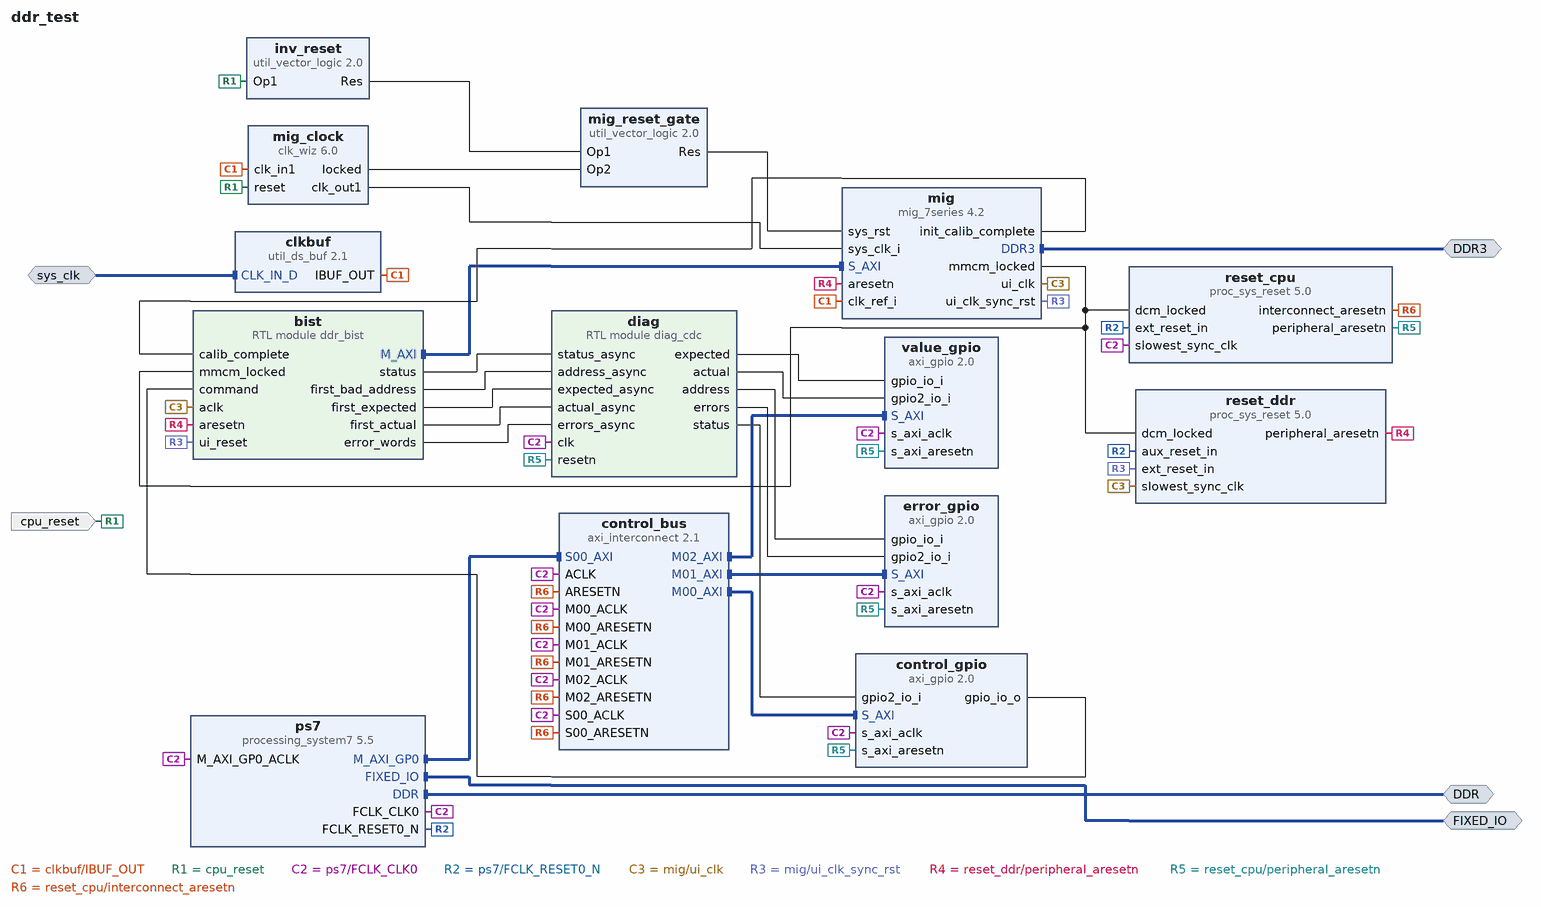
[diagram p0: block diagram of the top level]
# Vivado block design ddr_test, xc7z045ffg900-2, Vivado 2020.2
create_bd_design ddr_test

create_bd_intf_port -mode Master -vlnv xilinx.com:interface:ddrx_rtl:1.0 DDR
create_bd_intf_port -mode Master -vlnv xilinx.com:display_processing_system7:fixedio_rtl:1.0 FIXED_IO
create_bd_intf_port -mode Slave -vlnv xilinx.com:interface:diff_clock_rtl:1.0 sys_clk
set_property -dict {CONFIG.FREQ_HZ 200000000} [get_bd_intf_ports sys_clk]
create_bd_intf_port -mode Master -vlnv xilinx.com:interface:ddrx_rtl:1.0 DDR3
create_bd_port -dir I -type rst cpu_reset
set_property -dict {CONFIG.POLARITY ACTIVE_HIGH} [get_bd_ports cpu_reset]

create_bd_cell -type ip -vlnv xilinx.com:ip:processing_system7:5.5 ps7
set_property -dict [list \
  CONFIG.PCW_APU_PERIPHERAL_FREQMHZ 667.000000 \
  CONFIG.PCW_ENET0_PERIPHERAL_ENABLE 0 \
  CONFIG.PCW_FPGA0_PERIPHERAL_FREQMHZ 100 \
  CONFIG.PCW_GPIO_MIO_GPIO_ENABLE 1 \
  CONFIG.PCW_GPIO_MIO_GPIO_IO MIO \
  CONFIG.PCW_I2C_RESET_ENABLE 0 \
  CONFIG.PCW_PRESET_BANK0_VOLTAGE {LVCMOS 1.8V} \
  CONFIG.PCW_PRESET_BANK1_VOLTAGE {LVCMOS 1.8V} \
  CONFIG.PCW_QSPI_PERIPHERAL_ENABLE 0 \
  CONFIG.PCW_SD0_PERIPHERAL_ENABLE 0 \
  CONFIG.PCW_UART1_PERIPHERAL_ENABLE 1 \
  CONFIG.PCW_UART1_UART1_IO {MIO 48 .. 49} \
  CONFIG.PCW_UART_PERIPHERAL_FREQMHZ 100 \
  CONFIG.PCW_UIPARAM_DDR_FREQ_MHZ 533.333313 \
  CONFIG.PCW_UIPARAM_DDR_PARTNO Custom \
  CONFIG.PCW_USB0_PERIPHERAL_ENABLE 0 \
  CONFIG.PCW_USB_RESET_ENABLE 1 \
] [get_bd_cells ps7]
# 242 more settings of ps7 are not shown: defaults, MIO pin electricals, DDR timing, and values the tool derives
create_bd_cell -type ip -vlnv xilinx.com:ip:util_ds_buf:2.1 clkbuf
set_property -dict {CONFIG.C_BUF_TYPE IBUFDS} [get_bd_cells clkbuf]
create_bd_cell -type ip -vlnv xilinx.com:ip:clk_wiz:6.0 mig_clock
set_property -dict [list \
  CONFIG.CLKOUT1_REQUESTED_OUT_FREQ 166.666667 \
  CONFIG.PRIM_IN_FREQ 200 \
  CONFIG.RESET_TYPE ACTIVE_HIGH \
  CONFIG.USE_LOCKED true \
  CONFIG.USE_RESET true \
] [get_bd_cells mig_clock]
create_bd_cell -type ip -vlnv xilinx.com:ip:mig_7series:4.2 mig
set_property -dict [list \
  CONFIG.BOARD_MIG_PARAM Custom \
  CONFIG.RESET_BOARD_INTERFACE Custom \
  CONFIG.XML_INPUT_FILE ../../../../../../../constraints/ddr2g_mig.prj \
] [get_bd_cells mig]
create_bd_cell -type ip -vlnv xilinx.com:ip:util_vector_logic:2.0 inv_reset
set_property -dict {CONFIG.C_OPERATION not CONFIG.C_SIZE 1} [get_bd_cells inv_reset]
create_bd_cell -type ip -vlnv xilinx.com:ip:util_vector_logic:2.0 mig_reset_gate
set_property -dict {CONFIG.C_OPERATION and CONFIG.C_SIZE 1} [get_bd_cells mig_reset_gate]
create_bd_cell -type ip -vlnv xilinx.com:ip:proc_sys_reset:5.0 reset_cpu
set_property -dict {CONFIG.C_AUX_RESET_HIGH 0} [get_bd_cells reset_cpu]
create_bd_cell -type ip -vlnv xilinx.com:ip:proc_sys_reset:5.0 reset_ddr
set_property -dict {CONFIG.C_AUX_RESET_HIGH 0} [get_bd_cells reset_ddr]
create_bd_cell -type module -reference diag_cdc diag
create_bd_cell -type ip -vlnv xilinx.com:ip:axi_interconnect:2.1 control_bus
set_property -dict {CONFIG.NUM_MI 3} [get_bd_cells control_bus]
create_bd_cell -type ip -vlnv xilinx.com:ip:axi_gpio:2.0 control_gpio
set_property -dict [list \
  CONFIG.C_ALL_INPUTS 0 \
  CONFIG.C_ALL_INPUTS_2 1 \
  CONFIG.C_ALL_OUTPUTS 1 \
  CONFIG.C_GPIO2_WIDTH 32 \
  CONFIG.C_GPIO_WIDTH 32 \
  CONFIG.C_IS_DUAL 1 \
] [get_bd_cells control_gpio]
create_bd_cell -type ip -vlnv xilinx.com:ip:axi_gpio:2.0 error_gpio
set_property -dict [list \
  CONFIG.C_ALL_INPUTS 1 \
  CONFIG.C_ALL_INPUTS_2 1 \
  CONFIG.C_GPIO2_WIDTH 32 \
  CONFIG.C_GPIO_WIDTH 32 \
  CONFIG.C_IS_DUAL 1 \
] [get_bd_cells error_gpio]
create_bd_cell -type ip -vlnv xilinx.com:ip:axi_gpio:2.0 value_gpio
set_property -dict [list \
  CONFIG.C_ALL_INPUTS 1 \
  CONFIG.C_ALL_INPUTS_2 1 \
  CONFIG.C_GPIO2_WIDTH 32 \
  CONFIG.C_GPIO_WIDTH 32 \
  CONFIG.C_IS_DUAL 1 \
] [get_bd_cells value_gpio]
create_bd_cell -type module -reference ddr_bist bist

# ---- connections ----

connect_bd_intf_net [get_bd_intf_ports DDR3] [get_bd_intf_pins mig/DDR3]
connect_bd_intf_net [get_bd_intf_pins bist/M_AXI] [get_bd_intf_pins mig/S_AXI]
connect_bd_intf_net [get_bd_intf_ports FIXED_IO] [get_bd_intf_pins ps7/FIXED_IO]
connect_bd_intf_net [get_bd_intf_pins control_bus/M02_AXI] [get_bd_intf_pins value_gpio/S_AXI]
connect_bd_intf_net [get_bd_intf_pins control_bus/M00_AXI] [get_bd_intf_pins control_gpio/S_AXI]
connect_bd_intf_net [get_bd_intf_pins control_bus/M01_AXI] [get_bd_intf_pins error_gpio/S_AXI]
connect_bd_intf_net [get_bd_intf_pins ps7/M_AXI_GP0] [get_bd_intf_pins control_bus/S00_AXI]
connect_bd_intf_net [get_bd_intf_ports sys_clk] [get_bd_intf_pins clkbuf/CLK_IN_D]
connect_bd_intf_net [get_bd_intf_ports DDR] [get_bd_intf_pins ps7/DDR]
connect_bd_net [get_bd_pins clkbuf/IBUF_OUT] [get_bd_pins mig_clock/clk_in1] [get_bd_pins mig/clk_ref_i]
connect_bd_net [get_bd_ports cpu_reset] [get_bd_pins mig_clock/reset] [get_bd_pins inv_reset/Op1]
connect_bd_net [get_bd_pins mig_clock/clk_out1] [get_bd_pins mig/sys_clk_i]
connect_bd_net [get_bd_pins inv_reset/Res] [get_bd_pins mig_reset_gate/Op1]
connect_bd_net [get_bd_pins mig_clock/locked] [get_bd_pins mig_reset_gate/Op2]
connect_bd_net [get_bd_pins mig_reset_gate/Res] [get_bd_pins mig/sys_rst]
connect_bd_net [get_bd_pins ps7/FCLK_CLK0] \
  [get_bd_pins reset_cpu/slowest_sync_clk] [get_bd_pins ps7/M_AXI_GP0_ACLK] [get_bd_pins diag/clk] \
  [get_bd_pins control_bus/ACLK] [get_bd_pins control_bus/S00_ACLK] [get_bd_pins control_bus/M00_ACLK] \
  [get_bd_pins control_bus/M01_ACLK] [get_bd_pins control_bus/M02_ACLK] [get_bd_pins control_gpio/s_axi_aclk] \
  [get_bd_pins error_gpio/s_axi_aclk] [get_bd_pins value_gpio/s_axi_aclk]
connect_bd_net [get_bd_pins ps7/FCLK_RESET0_N] [get_bd_pins reset_cpu/ext_reset_in] [get_bd_pins reset_ddr/aux_reset_in]
connect_bd_net [get_bd_pins mig/mmcm_locked] [get_bd_pins reset_cpu/dcm_locked] [get_bd_pins reset_ddr/dcm_locked] [get_bd_pins bist/mmcm_locked]
connect_bd_net [get_bd_pins mig/ui_clk] [get_bd_pins reset_ddr/slowest_sync_clk] [get_bd_pins bist/aclk]
connect_bd_net [get_bd_pins mig/ui_clk_sync_rst] [get_bd_pins reset_ddr/ext_reset_in] [get_bd_pins bist/ui_reset]
connect_bd_net [get_bd_pins reset_ddr/peripheral_aresetn] [get_bd_pins mig/aresetn] [get_bd_pins bist/aresetn]
connect_bd_net [get_bd_pins mig/init_calib_complete] [get_bd_pins bist/calib_complete]
connect_bd_net [get_bd_pins reset_cpu/peripheral_aresetn] \
  [get_bd_pins diag/resetn] [get_bd_pins control_gpio/s_axi_aresetn] [get_bd_pins error_gpio/s_axi_aresetn] \
  [get_bd_pins value_gpio/s_axi_aresetn]
connect_bd_net [get_bd_pins bist/status] [get_bd_pins diag/status_async]
connect_bd_net [get_bd_pins bist/first_bad_address] [get_bd_pins diag/address_async]
connect_bd_net [get_bd_pins bist/first_expected] [get_bd_pins diag/expected_async]
connect_bd_net [get_bd_pins bist/first_actual] [get_bd_pins diag/actual_async]
connect_bd_net [get_bd_pins bist/error_words] [get_bd_pins diag/errors_async]
connect_bd_net [get_bd_pins reset_cpu/interconnect_aresetn] \
  [get_bd_pins control_bus/ARESETN] [get_bd_pins control_bus/S00_ARESETN] [get_bd_pins control_bus/M00_ARESETN] \
  [get_bd_pins control_bus/M01_ARESETN] [get_bd_pins control_bus/M02_ARESETN]
connect_bd_net [get_bd_pins control_gpio/gpio_io_o] [get_bd_pins bist/command]
connect_bd_net [get_bd_pins diag/status] [get_bd_pins control_gpio/gpio2_io_i]
connect_bd_net [get_bd_pins diag/address] [get_bd_pins error_gpio/gpio_io_i]
connect_bd_net [get_bd_pins diag/errors] [get_bd_pins error_gpio/gpio2_io_i]
connect_bd_net [get_bd_pins diag/expected] [get_bd_pins value_gpio/gpio_io_i]
connect_bd_net [get_bd_pins diag/actual] [get_bd_pins value_gpio/gpio2_io_i]

# ---- address map ----
assign_bd_address -offset 0x00000000 -range 2G -target_address_space [get_bd_addr_spaces bist/M_AXI] [get_bd_addr_segs mig/memmap/memaddr]
assign_bd_address -offset 0x41200000 -range 64K -target_address_space [get_bd_addr_spaces ps7/Data] [get_bd_addr_segs control_gpio/S_AXI/Reg]
assign_bd_address -offset 0x41210000 -range 64K -target_address_space [get_bd_addr_spaces ps7/Data] [get_bd_addr_segs error_gpio/S_AXI/Reg]
assign_bd_address -offset 0x41220000 -range 64K -target_address_space [get_bd_addr_spaces ps7/Data] [get_bd_addr_segs value_gpio/S_AXI/Reg]

validate_bd_design
save_bd_design
